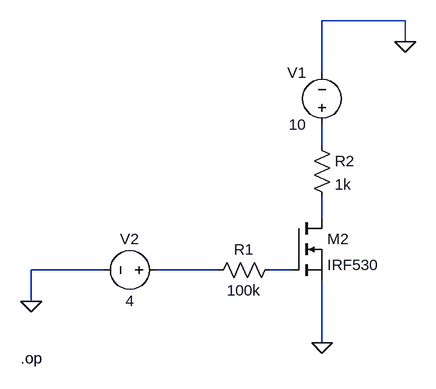
[diagram p0: schematic MOSFET switch.asc]
MOSFET switch.asc, the LTspice schematic file:
Version 4.1
SHEET 1 880 680
WIRE 416 -96 288 -96
WIRE 416 -64 416 -96
WIRE 288 -16 288 -96
WIRE 288 96 288 64
WIRE 288 208 288 176
WIRE -48 288 -160 288
WIRE 128 288 32 288
WIRE 240 288 208 288
WIRE -160 336 -160 288
WIRE 288 400 288 304
FLAG 416 -64 0
FLAG -160 336 0
FLAG 288 400 0
SYMBOL nmos 240 208 R0
SYMATTR InstName M2
SYMATTR Value IRF530
SYMBOL res 224 272 R90
WINDOW 0 0 56 VBottom 2
WINDOW 3 32 56 VTop 2
SYMATTR InstName R1
SYMATTR Value 100k
SYMBOL res 272 80 R0
SYMATTR InstName R2
SYMATTR Value 1k
SYMBOL voltage 288 80 R180
WINDOW 0 24 96 Left 2
WINDOW 3 24 16 Left 2
WINDOW 123 0 0 Left 0
WINDOW 39 0 0 Left 0
SYMATTR InstName V1
SYMATTR Value 10
SYMBOL voltage 48 288 R90
WINDOW 0 -32 56 VBottom 2
WINDOW 3 32 56 VTop 2
WINDOW 123 0 0 Left 0
WINDOW 39 0 0 Left 0
SYMATTR InstName V2
SYMATTR Value 4
TEXT -176 424 Left 2 !.op

The netlist it stands for:
* MOSFET switch.asc
M2 N002 N004 0 0 IRF530
R1 N004 N003 100k
R2 N001 N002 1k
V1 N001 0 10
V2 N003 0 4
.model NMOS NMOS
.model PMOS PMOS
.lib standard.mos
.op
.backanno
.end